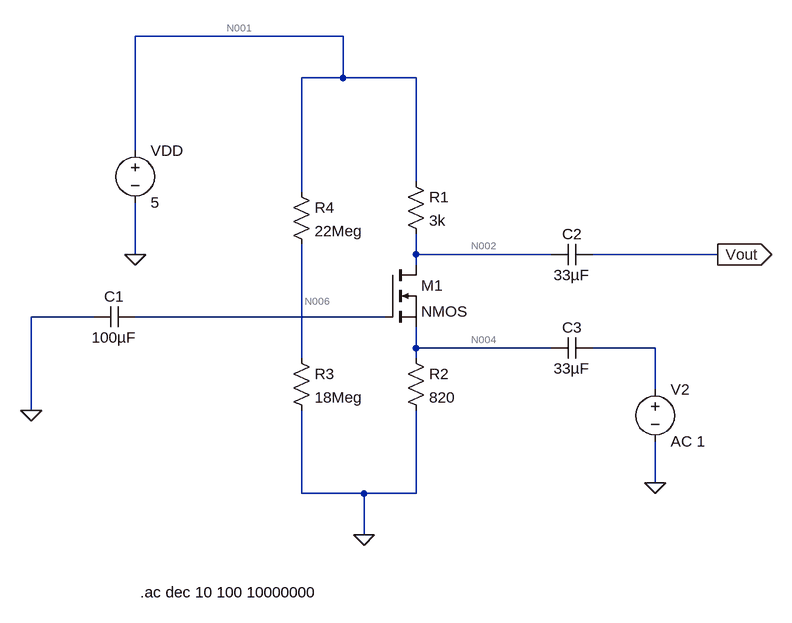
[diagram p0: schematic Draft1.asc]
Draft1.asc, the LTspice schematic file:
Version 4.1
SHEET 1 976 792
WIRE 288 -80 -32 -80
WIRE 288 -16 288 -80
WIRE 288 -16 224 -16
WIRE 400 -16 288 -16
WIRE -32 96 -32 -80
WIRE 400 144 400 -16
WIRE 224 160 224 -16
WIRE -32 256 -32 176
WIRE 400 256 400 224
WIRE 608 256 400 256
WIRE 864 256 672 256
WIRE 400 272 400 256
WIRE -96 352 -192 352
WIRE 352 352 -32 352
WIRE 400 400 400 368
WIRE 608 400 400 400
WIRE 768 400 672 400
WIRE 224 416 224 240
WIRE 400 416 400 400
WIRE 768 464 768 400
WIRE -192 496 -192 352
WIRE 768 608 768 544
WIRE 224 624 224 496
WIRE 320 624 224 624
WIRE 400 624 400 496
WIRE 400 624 320 624
WIRE 320 688 320 624
FLAG -32 256 0
FLAG -192 496 0
FLAG 320 688 0
FLAG 864 256 Vout
IOPIN 864 256 Out
FLAG 768 608 0
SYMBOL voltage -32 80 R0
SYMATTR InstName VDD
SYMATTR Value 5
SYMBOL res 384 128 R0
SYMATTR InstName R1
SYMATTR Value 3k
SYMBOL res 384 400 R0
SYMATTR InstName R2
SYMATTR Value 820
SYMBOL res 208 400 R0
SYMATTR InstName R3
SYMATTR Value 18Meg
SYMBOL res 208 144 R0
SYMATTR InstName R4
SYMATTR Value 22Meg
SYMBOL nmos 352 272 R0
SYMATTR InstName M1
SYMBOL cap -32 336 R90
WINDOW 0 0 32 VBottom 2
WINDOW 3 32 32 VTop 2
SYMATTR InstName C1
SYMATTR Value 100µF
SYMBOL cap 672 240 R90
WINDOW 0 0 32 VBottom 2
WINDOW 3 32 32 VTop 2
SYMATTR InstName C2
SYMATTR Value 33µF
SYMBOL cap 672 384 R90
WINDOW 0 0 32 VBottom 2
WINDOW 3 32 32 VTop 2
SYMATTR InstName C3
SYMATTR Value 33µF
SYMBOL voltage 768 448 R0
SYMATTR InstName V2
SYMATTR Value AC 1
TEXT -24 776 Left 2 !.ac dec 10 100 10000000

The netlist it stands for:
* Draft1.asc
VDD N001 0 5
R1 N001 N002 3k
R2 N004 0 820
R3 N006 0 18Meg
R4 N001 N006 22Meg
M1 N002 N003 N004 N004 NMOS
C1 N003 0 100µF
C2 Vout N002 33µF
C3 N005 N004 33µF
V2 N005 0 AC 1
.model NMOS NMOS
.model PMOS PMOS
.lib standard.mos
.ac dec 10 100 10000000
.backanno
.end

* Results of the author's LTspice run, read from the files saved beside the schematic
* Operating Point, zero values left out:
*   V(n002) = 5 V
*   V(n006) = 2.25 V
*   V(n001) = 5 V
*   V(n004) = 8.208 nV
*   V(vout) = 5 V
*   I(VDD) = -125 nA
*   I(R2) = 10.01 pA
*   I(R4) = 125 nA
*   Id(M1) = 10.01 pA
*   Is(M1) = -5 pA
*   Ib(M1) = -5.01 pA
*   I(R3) = 125 nA
*   I(R1) = 10.01 pA
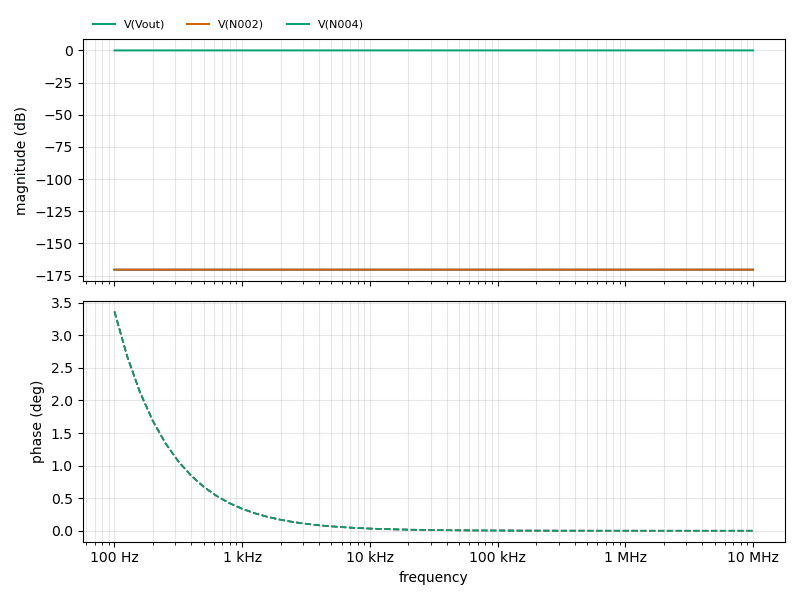
[diagram p1: AC Analysis of Draft1.asc, plotted from the saved traces]
* AC Analysis, 1 run:
*   V(Vout): -170.47 dB at 100 Hz, -170.46 dB at 10 MHz, peak -170.46 dB at 10 MHz
*   V(N002): -170.47 dB at 100 Hz, -170.46 dB at 10 MHz, peak -170.46 dB at 10 MHz
*   V(N004): -0.01 dB at 100 Hz, -0.00 dB at 10 MHz, peak -0.00 dB at 10 MHz